# Altium schematic sheet IO.SchDoc
size A2; SheetNumber: 3; SheetTotal: 6
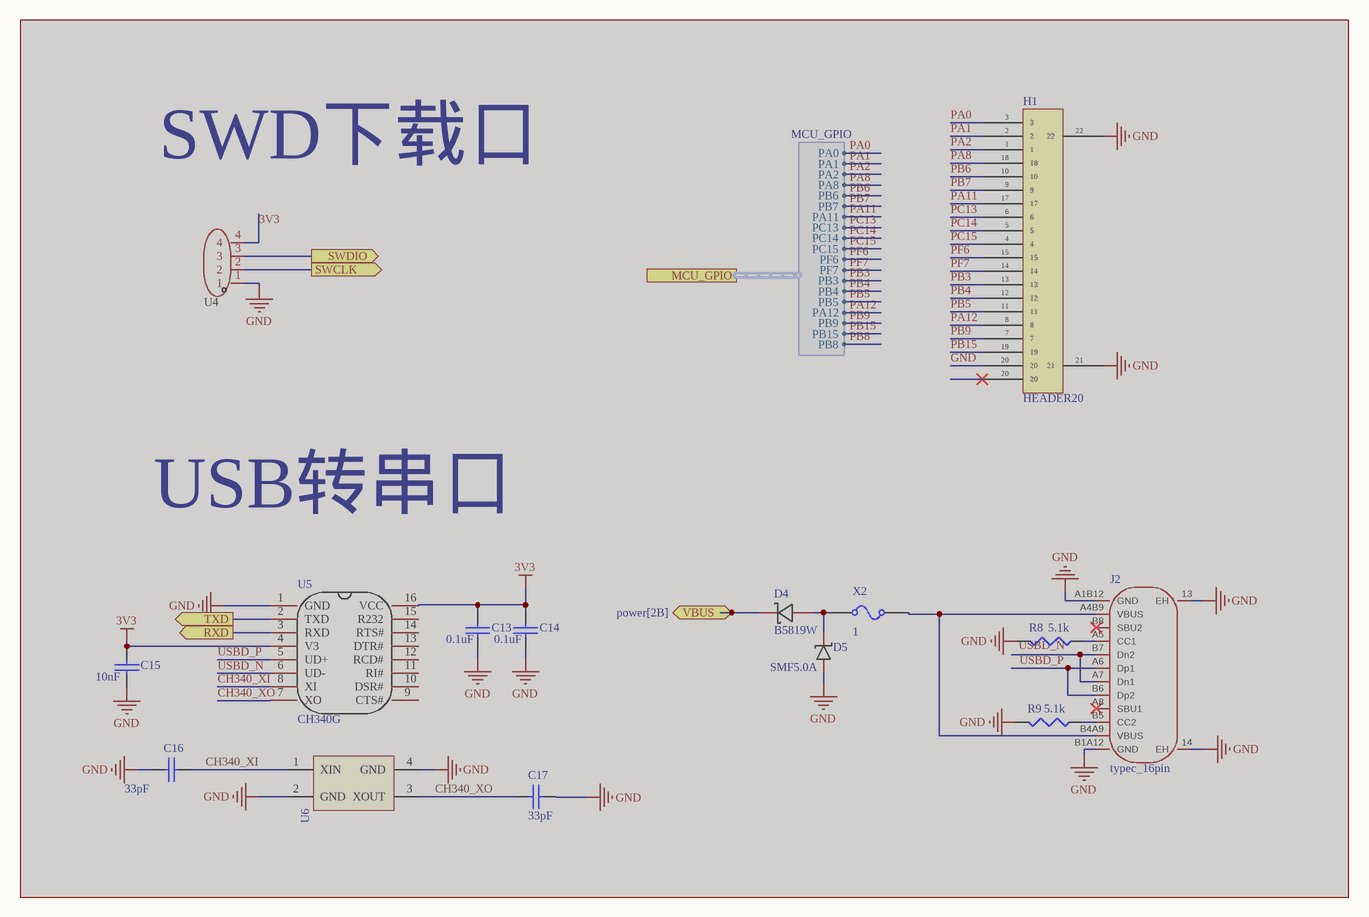
[diagram p0: IO.SchDoc]

## Parts
C13  0.1uF  [0402_Z]  (masked out: inside a compile mask, not in the netlist)
C14  0.1uF  [0402_Z]  (masked out: inside a compile mask, not in the netlist)
C15  10nF  [0402_Z]  (masked out: inside a compile mask, not in the netlist)
C16  33pF  [0402_Z]  (masked out: inside a compile mask, not in the netlist)
C17  33pF  [0402_Z]  (masked out: inside a compile mask, not in the netlist)
D4  B5819W  [BW5819W]  (masked out: inside a compile mask, not in the netlist)
D5  SMF5.0A  [SMF5.0A]  (masked out: inside a compile mask, not in the netlist)
H1  HEADER20  [Header20]  (masked out: inside a compile mask, not in the netlist)
J2  typec_16pin  [TYPEC_16PIN]  (masked out: inside a compile mask, not in the netlist)
R8  5.1k  [0402_Z]  (masked out: inside a compile mask, not in the netlist)
R9  5.1k  [0402_Z]  (masked out: inside a compile mask, not in the netlist)
U4  HDGC1251WR-4P  [J4_1.25]  (value not drawn)  (masked out: inside a compile mask, not in the netlist)
U5  CH340G  [CH340G]  (masked out: inside a compile mask, not in the netlist)
U6  12MHz  [CRYSTAL-SMD_4P-L3.2-W2.5-BL]  (value not drawn)  (masked out: inside a compile mask, not in the netlist)
X2  CURRENT: 1  [F1206]  (hidden comment: Fuse)  (masked out: inside a compile mask, not in the netlist)

## Ports
MCU_GPIO (harness MCU_GPIO), RXD (out), SWCLK (out), SWDIO (out), TXD (out), VBUS (bidir, see power[2B])

## Harnesses
MCU_GPIO: PA0, PA1, PA2, PA8, PB6, PB7, PA11, PC13, PC14, PC15, PF6, PF7, PB3, PB4, PB5, PA12, PB9, PB15, PB8

## Notes on the sheet
- SWD下载口
- USB转串口

## Library data of the parts
C13-C17 = CAP: 0402; Value: 20pF  NP0
D4 = B5819W: 肖特基二极管
R8 R9 = Res3: Resistor; Published: 8-Jun-2000; LatestRevisionDate: 04-Mar-2005; LatestRevisionNote: PCB Footprint replaced.; PackageReference: J1-0603; Publisher: Altium Limited; Value: 5.1k
U4 = MX1.25_弯针: 复旦微单片机程序下载接口; Manufacturer: HDGC(华德共创); Add into BOM: yes; Name: HDGC1251WR-4P; Symbol: HDGC1251WR-4P; Device: HDGC1251WR-4P; LCSC Part Name: MX1.25弯针 4P; Supplier Part: C5175205; Manufacturer Part: HDGC1251WR-4P; Supplier Footprint: 直插,P=1.25mm; JLCPCB Part Class: Extended Part; Datasheet: https://atta.szlcsc.com/upload/public/pdf/source/20220916/6B39EFECC0008CEF03BA0E93409F6DCC.pdf; Supplier: LCSC; Convert to PCB: yes
U6 = XTAL 3225: PCB DECAL: 3225; Source_Path: E:\LI LELE\DESIGN KIT\DESIGN KIT_ESP8089_DEMO\ESP8089_DEMO.DSN
X2 = Fuse: RESISTANCE: 1m; SimulationGenericComponent: True